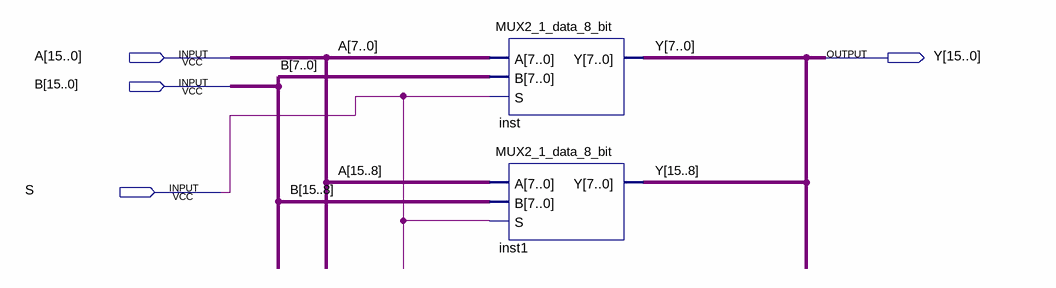
[diagram p0: schematic sheet]
// Quartus schematic MUX2_1_data_16_bit.bdf as structural Verilog: 2 symbols, 4 pins
module MUX2_1_data_16_bit (
  input  [15:0] A,
  input  [15:0] B,
  input  S,
  output [15:0] Y
);

  MUX2_1_data_8_bit inst (.A(A[7:0]), .B(B[7:0]), .S(S), .Y(Y[7:0]));
  MUX2_1_data_8_bit inst1 (.A(A[15:8]), .B(B[15:8]), .S(S), .Y(Y[15:8]));
endmodule
